# Altium schematic sheet BandPass_Sch_868MHz.SchDoc
size A4; SheetNumber: 1; SheetTotal: 1
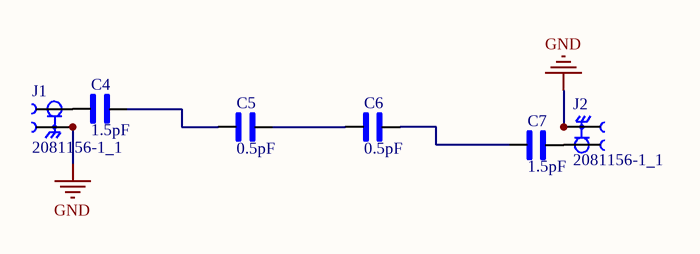
[diagram p0: BandPass_Sch_868MHz.SchDoc]

## Parts
C4  1.5pF  [CAPC0603X33N]
C5  0.5pF  [CAPC0603X33N]
C6  0.5pF  [CAPC0603X33N]
C7  1.5pF  [CAPC0603X33N]
J1  2081156-1_1  [TE_2081156-1 - duplicate]
J2  2081156-1_1  [TE_2081156-1 - duplicate]

## Nets
GND: J1.2(SH) J1.3(SH) J1.4(SH) J1.5(SH) J2.2(SH) J2.3(SH) J2.4(SH) J2.5(SH)
NetC4_1: C4.1 J1.1(SIG)
NetC4_2: C4.2 C5.1
NetC5_2: C5.2 C6.1
NetC6_2: C6.2 C7.1
NetC7_2: C7.2 J2.1(SIG)

## Library data of the parts
C4 C7 = C0603X5R1A104M030BC: Cap Ceramic 1,5pF 0603; Value: 1,5pF; MF: TDK; SnapEDA_Link: https://www.snapeda.com/parts/C0603X5R1A104M030BC/TDK/view-part/?ref=snap; Package: 0603 Taiyo Yuden; MP: C0603X5R1A104M030BC; Check_prices: https://www.snapeda.com/parts/C0603X5R1A104M030BC/TDK/view-part/?ref=eda
C5 C6 = 0.5pF Cap 0603: Cap Ceramic 0,5pF 0603; Value: 0,5pF; MF: TDK; MP: C0603X5R1A104M030BC; SnapEDA_Link: https://www.snapeda.com/parts/C0603X5R1A104M030BC/TDK/view-part/?ref=snap; Package: 0603 Taiyo Yuden; Check_prices: https://www.snapeda.com/parts/C0603X5R1A104M030BC/TDK/view-part/?ref=eda
J1 J2 = 2081156-1_1: SMA Connector Jack, Female Socket 50 Ohms Through Hole Solder; MF: TE Connectivity; SnapEDA_Link: https://www.snapeda.com/parts/2081156-1/TE+Connectivity+AMP+Connectors/view-part/?ref=snap; Package: None; Value: *; MP: 2081156-1; Check_prices: https://www.snapeda.com/parts/2081156-1/TE+Connectivity+AMP+Connectors/view-part/?ref=eda